# Altium project RS485_LoRa_Gateway.PrjPcb
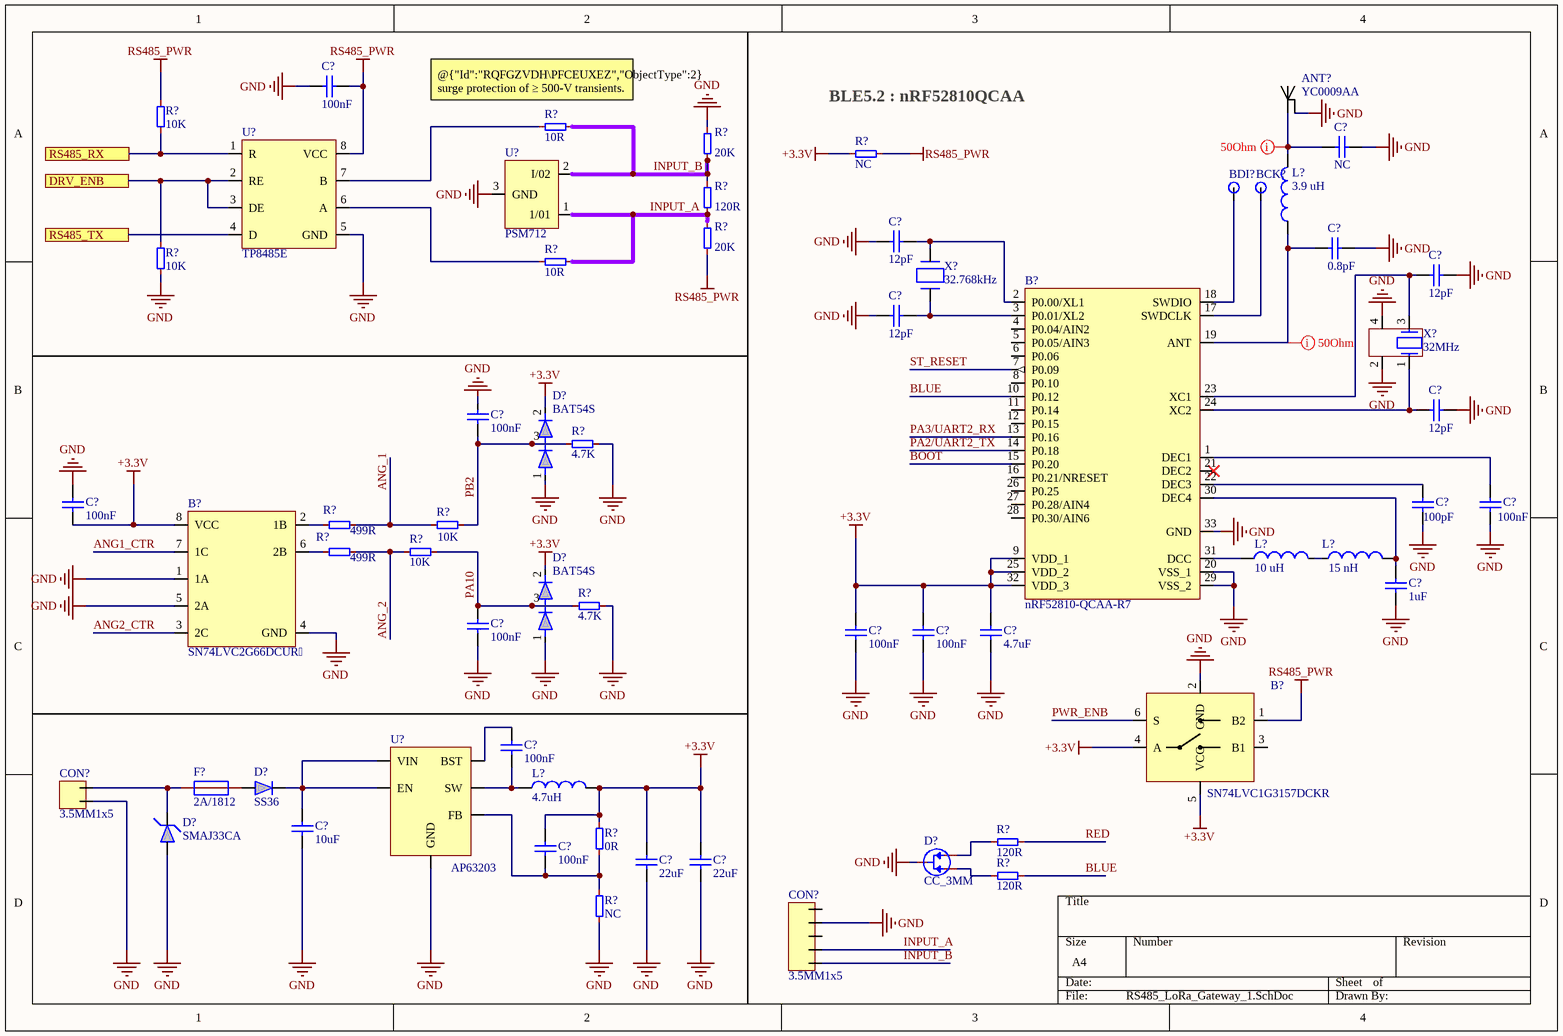
[diagram p0: RS485_LoRa_Gateway_1.SchDoc]
3 sheets, 117 parts. Net scope: flat (ports and power ports of the same name join across sheets).
Sheets:
  RS485_LoRa_Gateway_1.SchDoc
  RS485_LoRa_Gateway_2.SchDoc
  RS485_LoRa_Gateway_3.SchDoc

## Sheet RS485_LoRa_Gateway_1.SchDoc
size A4; SheetNumber: 1; SheetTotal: 3

### Parts
(Parts that share a designator on the sheet are numbered #1, #2 ... from top to bottom, then left to right.)
ANT?  YC0009AA  [YC009AA]
B?#1  nRF52810-QCAA-R7  [QFN50P500X500X95-33N]
B?#2  SN74LVC2G66DCUR  [SOP50P310X90-8N]
B?#3  SN74LVC1G3157DCKR  [SOT65P210X110-6N]
BCK?  -  [TH_Pad]  (value not drawn)  (net tie, no BOM)
BDI?  -  [TH_Pad]  (value not drawn)  (net tie, no BOM)
C?#1  100nF  [CAP0402]
C?#2  NC  [CAP0402]  (net tie, no BOM)
C?#3  12pF  [CAP0402]
C?#4  0.8pF  [CAP0402]
C?#5  12pF  [CAP0402]
C?#6  12pF  [CAP0402]
C?#7  100nF  [CAP0402]
C?#8  12pF  [CAP0402]
C?#9  100nF  [CAP0402]
C?#10  100pF  [CAP0402]
C?#11  100nF  [CAP0402]
C?#12  1uF  [CAP0603]
C?#13  100nF  [CAP0402]
C?#14  100nF  [CAP0402]
C?#15  100nF  [CAP0402]
C?#16  4.7uF  [CAP0603]
C?#17  100nF  [CAP0402]
C?#18  10uF  [CAP0805]
C?#19  100nF  [CAP0402]
C?#20  22uF  [CAP0805]
C?#21  22uF  [CAP0805]
CON?#1  3.5MM1x5  [SCREW TERMINAL BLOCK 3.5MM 2X1]
CON?#2  3.5MM1x5  [Terminal_Block_5-P3.5]
D?#1  BAT54S  [SOT23]
D?#2  BAT54S  [SOT23]
D?#3  SS36  [Diode SMD 214AC]
D?#4  SMAJ33CA  [Diode SMD 214AC]
D?#5  CC_3MM  [LED_BiColor_smd]
F?  2A/1812  [FUSC4632X85N]
L?#1  3.9 uH  [IND_0402]
L?#2  value 10 uH  [IND_0603]  (hidden comment: 10uH)
L?#3  value 15 nH  [IND_0402]  (hidden comment: 15nH)
L?#4  4.7uH  [IND_3x3x1.5MM]
R?#1  10K  [RESC0402]
R?#2  10R  [RESC0603]
R?#3  value 20K  [RESC0402]  (hidden comment: NC)
R?#4  NC  [RESC0402]
R?#5  value 120R  [RESC0402]  (hidden comment: NC)
R?#6  value 20K  [RESC0402]  (hidden comment: NC)
R?#7  10K  [RESC0402]
R?#8  10R  [RESC0603]
R?#9  4.7K  [RESC0402]
R?#10  499R  [RESC0805]
R?#11  10K  [RESC0402]
R?#12  499R  [RESC0805]
R?#13  10K  [RESC0402]
R?#14  4.7K  [RESC0402]
R?#15  0R  [RESC0402]
R?#16  120R  [RESC0402]
R?#17  120R  [RESC0402]
R?#18  NC  [RESC0402]
U?#1  TP8485E  [SOIC8]
U?#2  PSM712  [SOT23]
U?#3  AP63203  [SOT23-6]
X?#1  value 32.768kHz  [OSC_3215]  (hidden comment: VALUE)
X?#2  value 32MHz  [OSC_2016]  (hidden comment: OSC_2016)

### Ports
DRV_ENB, RS485_RX (see RS485_LoRa_Gateway_2[1B]), RS485_TX (see RS485_LoRa_Gateway_2[1B])

### Nets
+3.3V: B?#1.9(VDD_1) B?#1.25(VDD_2) B?#1.32(VDD_3) B?#2.8(VCC) B?#3.4(A) B?#3.5(VCC) C?#9.2 C?#14.2 C?#15.2 C?#16.2 C?#19.2 C?#20.2 C?#21.2 D?#1.2 D?#2.2 L?#4.2 R?#4.2 R?#15.1
GND: ANT?.2 B?#1.20(VSS_1) B?#1.29(VSS_2) B?#1.33(GND) B?#2.1(1A) B?#2.4(GND) B?#2.5(2A) B?#3.2(GND) C?#1.1 C?#2.1 C?#3.1 C?#4.1 C?#5.1 C?#6.1 C?#7.2 C?#8.1 C?#9.1 C?#10.2 C?#11.2 C?#12.1 C?#13.1 C?#14.1 C?#15.1 C?#16.1 C?#18.1 C?#20.1 C?#21.1 CON?#1.1 CON?#2.4 D?#1.1 D?#2.1 D?#4.2(A) D?#5.2(C) R?#3.2 R?#7.1 R?#9.1 R?#14.1 R?#18.2 U?#1.5(GND) U?#2.3(GND) U?#3.4(GND) X?#2.2 X?#2.4
RS485_PWR: B?#3.1(B2) C?#1.2 R?#1.2 R?#4.1 R?#6.1 U?#1.8(VCC)
ANG1_CTR: B?#2.7(1C)
ANG2_CTR: B?#2.3(2C)
ANG_1: R?#10.2 R?#11.2
ANG_2: R?#12.2 R?#13.2
BLUE: B?#1.10(P0.12) R?#17.1
BOOT: B?#1.15(P0.20)
INPUT_A: CON?#2.2 R?#5.1 R?#6.2 R?#8.2 U?#2.1(1/01)
INPUT_B: CON?#2.1 R?#2.2 R?#3.1 R?#5.2 U?#2.2(I/02)
PA2/UART2_TX: B?#1.14(P0.18)
PA3/UART2_RX: B?#1.13(P0.16)
PA10: C?#13.2 D?#2.3 R?#13.1 R?#14.2
PB2: C?#7.1 D?#1.3 R?#9.2 R?#11.1
PWR_ENB: B?#3.6(S)
RED: R?#16.1
ST_RESET: B?#1.7(P0.09)
NetANT?_1: ANT?.1 C?#2.2 L?#1.2
NetB?#1_1: B?#1.1(DEC1) C?#11.1
NetB?#1_2: B?#1.2(P0.00/XL1) C?#3.2 X?#1.2(X2)
NetB?#1_3: B?#1.3(P0.01/XL2) C?#6.2 X?#1.1(X1)
NetB?#1_17: B?#1.17(SWDCLK) BCK?.1
NetB?#1_18: B?#1.18(SWDIO) BDI?.1
NetB?#1_19: B?#1.19(ANT) C?#4.2 L?#1.1
NetB?#1_22: B?#1.22(DEC3) C?#10.1
NetB?#1_23: B?#1.23(XC1) C?#5.2 X?#2.3
NetB?#1_24: B?#1.24(XC2) C?#8.2 X?#2.1
NetB?#1_30: B?#1.30(DEC4) C?#12.2 L?#3.2
NetB?#1_31: B?#1.31(DCC) L?#2.1
NetB?#2_2: B?#2.2(1B) R?#10.1
NetB?#2_6: B?#2.6(2B) R?#12.1
NetC?#17_1: C?#17.1 L?#4.1 U?#3.5(SW)
NetC?#17_2: C?#17.2 U?#3.6(BST)
NetC?#18_2: C?#18.2 D?#3.1(K) U?#3.2(EN) U?#3.3(VIN)
NetC?#19_1: C?#19.1 R?#15.2 R?#18.1 U?#3.1(FB)
NetCON?#1_2: CON?#1.2 D?#4.1(K) F?.1
NetD?#3_2: D?#3.2(A) F?.2
NetD?#5_1: D?#5.1(A) R?#16.2
NetD?#5_3: D?#5.3(A) R?#17.2
NetL?#2_2: L?#2.2 L?#3.1
NetR?#1_1: R?#1.1 U?#1.1(R) ; port RS485_RX
NetR?#2_1: R?#2.1 U?#1.7(B)
NetR?#7_2: R?#7.2 U?#1.2(RE) U?#1.3(DE) ; port DRV_ENB
NetR?#8_1: R?#8.1 U?#1.6(A)
NetU?#1_4: U?#1.4(D) ; port RS485_TX

Not connected (* = marked no-connect by the designer): B?#1 4(P0.04/AIN2) 5(P0.05/AIN3) 6(P0.06) 8(P0.10) 11(P0.14) 12(P0.15) 16(P0.21/NRESET) 21(DEC2)* 26(P0.25) 27(P0.28/AIN4) 28(P0.30/AIN6); B?#3 3(B1); CON?#2 3 5

### Layout directives
net class 50Ohm; rule Width Constraint [Pref Width = 0.254mm    Min Width = 0.254mm    Max Width = 0.254mm]: NetANT?_1, NetB?#1_19

### Notes on the sheet
- (near R?#2) @{"Id":"RQFGZVDH\PFCEUXEZ","ObjectType":2}  surge protection of ≥ 500-V transients.
- (near R?#4) BLE5.2 : nRF52810QCAA

### Library data of the parts
ANT? = YC0009AA: Antennas Embedded, 2400-2500 MHz, Wi-Fi (Bluetooth), Ceramic, -, -, SMD, 3.2 YCA009AA; Manufacturer: Quectel; Manufacturer_Part_Number: YC0009AA
B?#1 = nRF52810-QCAA-R7: NORDIC SEMICONDUCTOR - NRF52810-QCAA-R7 - RF Transceiver, 2.36GHz to 2.5GHz, FSK, 2Mbps, 4dBm out, -89dBm in, 1.7V to 3.6V, QFN-32; Manufacturer: Nordic Semiconductor; Manufacturer_Part_Number: nRF52810-QCAA-R7
B?#2 = SN74LVC2G66DCUR: 2-Channel, 1:1 Analog Switch with Low On-State Resistance; Manufacturer: Texas Instruments; Manufacturer_Part_Number: SN74LVC2G66DCUR
B?#3 = SN74LVC1G: SN74LVC1G3157DCKR, Analogue Switch Single SPDT, 3, 5V, 6-Pin, SC-70; Manufacturer: Texas Instruments; Geometry.Height: 1.1mm; Manufacturer_Part_Number: SN74LVC1G3157DCKR; Arrow Part Number: SN74LVC1G3157DCKR; Arrow Price/Stock: https://www.arrow.com/en/products/sn74lvc1g3157dckr/texas-instruments?region=nac; Datasheet Link: http://www.ti.com/lit/ds/symlink/sn74lvc1g3157.pdf
BCK? BDI? = TH_PAD: Through Hole pad 1mm 0.5mm Hole
C?#1 C?#7 C?#9 C?#11 C?#13-C?#15 C?#17 C?#19 = Capa_0402: Ceramic Capacitor C0G, NP0 0402 100nF 35V; Manufacturer_Part_Number: GRM155R61A104KA01J; Manufacturer: MURATA
C?#2 = Capa_0402
C?#3 C?#5 C?#6 C?#8 = Capa_0402: Multilayer Ceramic Capacitors MLCC - SMD/SMT 50 V 12 pF C0G 0402 5%; Manufacturer_Part_Number: CC0402JRNPO9BN120; Manufacturer: YAGEO
C?#4 = Capa_0402: Ceramic Capacitor C0G, NP0 0402 0.8pF 50V; Manufacturer_Part_Number: CC0402BRNPO9BNR80; Manufacturer: YAGEO
C?#10 = Capa_0402: Ceramic Capacitor C0G, NP0 0402 100nF 50V; Manufacturer_Part_Number: GRM1555C1H101FA01D; Manufacturer: MURATA
C?#12 = Capa_0603: MLCC - SMD/SMT 1 uF 16 VDC 10% 0603 X5R; Manufacturer_Part_Number: GRM188R61C105MA12D; Manufacturer: MURATA
C?#16 = Capa_0603: MLCC - SMD/SMT 4.7 uF 16 VDC 10% 0603 X5R; Manufacturer_Part_Number: CL10A475KQ8NNNC; Manufacturer: Samsung Electro-Mechanics
C?#18 = Capa_0805: MLCC - SMD/SMT 10 uF 50VDC 10% 0805 X6S; Manufacturer_Part_Number: CC0805KKX5R9BB106; Manufacturer: YAGEO
C?#20 = Capa_0805: MLCC - SMD/SMT 22uF 10VDC 20% 0805 X6S; Manufacturer_Part_Number: CC0805KKX7R6BB226; Manufacturer: YAGEO
C?#21 = Capa_0805: MLCC - SMD/SMT 22uF 10VDC 20% 0805 X6S; Manufacturer_Part_Number: CC0805KKX7R6BB226; Manufacturer: MURATA
CON?#1 = Screw Terminal Block 2x1 3.5mm: 3.5mm 1*2 Screw Terminal Block; Manufacturer: XINYA; Package: 1x2x3.5; Manufacturer_Part_Number: *; Supplier: ROBU; Price: *
CON?#2 = Screw Terminal Block 5x1 3.5mm: 3.5mm 1*5 Screw Terminal Block
D?#1 D?#2 = BAT54SWT1G: BAT54S Schottky Diodes & Rectifiers SS SHKY DIO 30V TR; Manufacturer_Part_Number: Nexperia; Manufacturer: BAT54S,235
D?#3 = DIODE: SS36-Slkor-60V 750mV@3A 3A SMA(DO-214AC) Schottky Diodes ROHS\; Manufacturer: Slkor; Manufacturer_Part_Number: SS36; Supplier: Robu; Price: *; Package: DO-214AC
D?#4 = DIODE-ESD: SMAJ36A - 36V 400W ESD Suppressor TVS Diodes 2Pin SMA DO-214AC; Manufacturer: JD; Manufacturer_Part_Number: SMAJ33CA; Supplier: Eveleta; Package: DO-214AC; Price: *
D?#5 = LED_CC: LED Common cathod
F? = Fuse: Resettable Fuse - PTC 24V 01.5A 1812 - SMD1812B150TF/24; Manufacturer: Yageo; Manufacturer_Part_Number: SMD1812B150TF/24; Package: SMD1812; Supplier: *
L?#1 = Inductor: 3.9 nH High frequency chip inductor ±5%  0402; Manufacturer_Part_Number: LQG15HS3N9B02D; Manufacturer: Murata
L?#2 = MCD-01330: 10uH Chip inductor, IDC,min = 50 mA, ±20% 0603; Manufacturer_Part_Number: MLZ1608E100MT; Manufacturer: TDK
L?#3 = MCD-01330: 15 nH High frequency chip inductor ±10% 0402; Manufacturer_Part_Number: LQG15HN15NJ02D; Manufacturer: Murata
L?#4 = INDUCTOR: 1.09A 4.7uH ±3% 163mΩ 3015 Inductors; Manufacturer_Part_Number: SWPA3015S4R7MT; Manufacturer: SUNLORD; Package: 3015; Supplier: Evelta; Price: 6.9
R?#1 R?#7 = RES_0402: Thick Film Resistors - SMD 1/16watt 10Kohms 0402 1% Commercial Use; Manufacturer_Part_Number: CRCW040210K0FKEDC; Manufacturer: Vishay; Parameter 1: *
R?#2 R?#8 = RES_0603: Thick Film Resistors - SMD 1/10Watt 10ohms 1% Commercial Use; Manufacturer_Part_Number: CRCW060310R0FKEBC; Manufacturer: Vishay; Parameter 1: *
R?#3 R?#5 R?#6 = RES_0402: Resistor SMD 0402; Manufacturer_Part_Number: *; Manufacturer: *
R?#4 = RES_0402: Thick Film Resistors - SMD 1/16watt 0R 1% 0402 Commercial Use; Manufacturer_Part_Number: RC0402FR-070RL; Manufacturer: YAGEO; Parameter 1: *
R?#9 R?#14 = RES_0402: Thin Film Resistors - SMD 4.7Kohms 0.1% 0402 25ppm; Manufacturer_Part_Number: RT0402BRD074K7L; Manufacturer: YAGEO; Parameter 1: *
R?#10 R?#12 = RES_0805: Thin Film Resistors - SMD 499ohms 0.1% 25ppm; Manufacturer_Part_Number: TNPW0805499RBEEA; Manufacturer: Vishay; Parameter 1: *
R?#11 R?#13 R?#18 = RES_0402: Thick Film Resistors - SMD 1/16watt 10Kohms 0.1% 0402 Commercial Use; Manufacturer_Part_Number: MCS04020D1002BE000; Manufacturer: Vishay; Parameter 1: *
R?#15 = RES_0402: Thick Film Resistors - SMD 1/16watt 0R 1% 0402 Commercial Use; Manufacturer_Part_Number: RC0402FR-070RL; Manufacturer: Vishay; Parameter 1: *
R?#16 = RES_0402: Thin Film Resistors - SMD 120Kohms 1% 0402 25ppm; Manufacturer_Part_Number: RT0402FRE07120RL; Manufacturer: YAGEO; Parameter 1: *
R?#17 = RES_0402: Thin Film Resistors - SMD 120Rs 1% 0402 25ppm; Manufacturer_Part_Number: RT0402FRE07120RL; Manufacturer: YAGEO; Parameter 1: *
U?#1 = TP8485E: TP8485E RS485 Tranreciver 3V-5.5V SOIC8; Manufacturer: 3PEAK; Manufacturer_Part_Number: TP8485
U?#2 = PSM712: Asymmerical TVS Diode for Extended Common-Mode RS-485; Manufacturer_Part_Number: SM712H-TP-B002; Manufacturer: Micro Commercial Components (MCC)
U?#3 = AP63205: AP63205 - Switching Voltage Regulators 5V OUT DCDC 3.8V-32V Conv HV Buck TSOT26 T&R 3K; Manufacturer_Part_Number: AP63203QWU-7; Manufacturer: Diodes Incorporated; Price: *
X?#1 = OSC_2012: Crystal Osc 2012; Manufacturer_Part_Number: ECS-.327-12.5-34B-TR; Manufacturer: ECS
X?#2 = OSC_2016: Crystal Osc 2016 32MHz; Manufacturer_Part_Number: XRCGB32M000F2P01R0; Manufacturer: Murata

## Sheet RS485_LoRa_Gateway_2.SchDoc
size A4; SheetNumber: 2; SheetTotal: 3
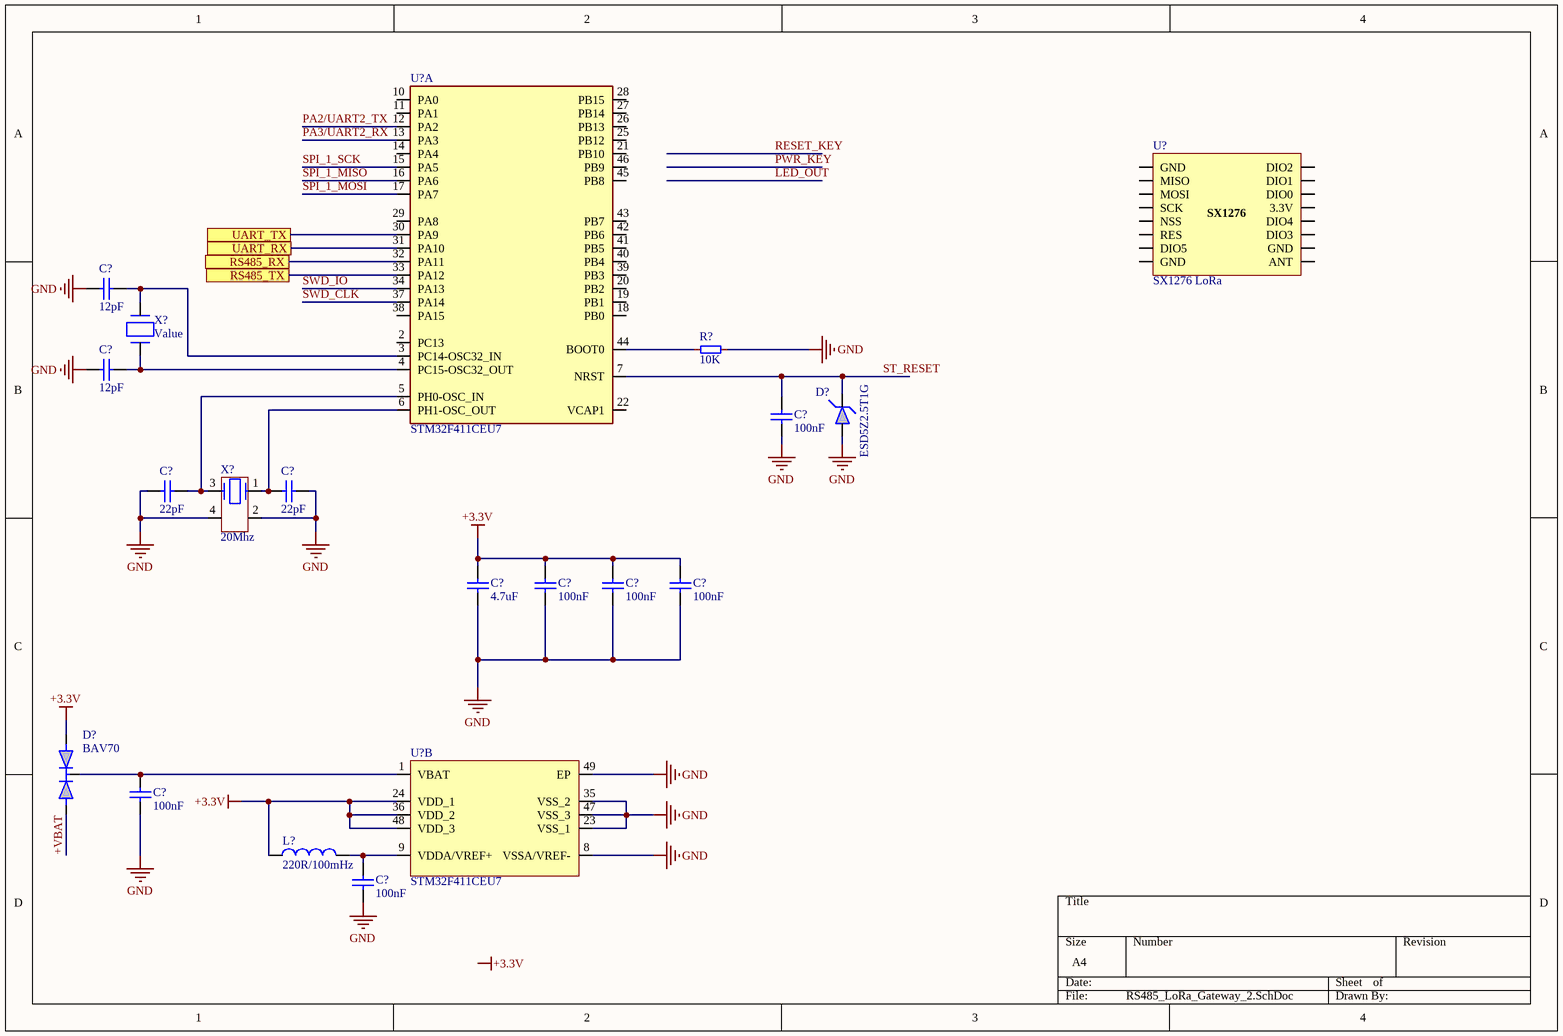
[diagram p1: RS485_LoRa_Gateway_2.SchDoc]

### Parts
(Parts that share a designator on the sheet are numbered #1, #2 ... from top to bottom, then left to right.)
C?#22  12pF  [CAP0402]
C?#23  12pF  [CAP0402]
C?#24  100nF  [CAP0402]
C?#25  22pF  [CAP0402]
C?#26  22pF  [CAP0402]
C?#27  4.7uF  [CAP0603]
C?#28  100nF  [CAP0402]
C?#29  100nF  [CAP0402]
C?#30  100nF  [CAP0402]
C?#31  100nF  [CAP0402]
C?#32  100nF  [CAP0402]
D?#6  ESD5Z2.5T1G  [SOD523]
D?#7  BAV70  [SOT23-3]
L?#5  220R/100mHz  [IND_0603]
R?#19  10K  [RESC0402]
U?#4  STM32F411CEU7  [QFN48]  (part A of 2)
U?#5  SX1276 LoRa  [RFM95]
U?#6  STM32F411CEU7  [QFN48]  (part B of 2)
X?#3  32.768kHz  [OSC_3215]  (value not drawn)
X?#4  20Mhz  [OSC_3225]

### Ports
RS485_RX (see RS485_LoRa_Gateway_1[1A]), RS485_TX (see RS485_LoRa_Gateway_1[1A]), UART_RX (see RS485_LoRa_Gateway_3[5C]), UART_TX (see RS485_LoRa_Gateway_3[6C])

### Nets
+3.3V: C?#27.2 C?#28.2 C?#29.2 C?#30.2 D?#7.1 L?#5.1 U?#6.24(VDD_1) U?#6.36(VDD_2) U?#6.48(VDD_3)
GND: C?#22.2 C?#23.2 C?#24.1 C?#25.2 C?#26.1 C?#27.1 C?#28.1 C?#29.1 C?#30.1 C?#31.1 C?#32.1 D?#6.2(A) R?#19.1 U?#6.8(VSSA/VREF-) U?#6.23(VSS_1) U?#6.35(VSS_2) U?#6.47(VSS_3) U?#6.49(EP) X?#4.2 X?#4.4
+VBAT: D?#7.2
PA2/UART2_TX: U?#4.12(PA2)
PA3/UART2_RX: U?#4.13(PA3)
SPI_1_MISO: U?#4.16(PA6)
SPI_1_MOSI: U?#4.17(PA7)
SPI_1_SCK: U?#4.15(PA5)
ST_RESET: C?#24.2 D?#6.1(K) U?#4.7(NRST)
SWD_CLK: U?#4.37(PA14)
SWD_IO: U?#4.34(PA13)
NetB4_1: U?#4.31(PA10) ; port UART_RX
NetB4_8: U?#4.30(PA9) ; port UART_TX
NetC?#22_1: C?#22.1 U?#4.3(PC14-OSC32_IN) X?#3.2(X2)
NetC?#23_1: C?#23.1 U?#4.4(PC15-OSC32_OUT) X?#3.1(X1)
NetC?#25_1: C?#25.1 U?#4.5(PH0-OSC_IN) X?#4.3
NetC?#26_2: C?#26.2 U?#4.6(PH1-OSC_OUT) X?#4.1
NetC?#31_2: C?#31.2 D?#7.3 U?#6.1(VBAT)
NetC?#32_2: C?#32.2 L?#5.2 U?#6.9(VDDA/VREF+)
NetR?#1_1: U?#4.32(PA11) ; port RS485_RX
NetR?#19_2: R?#19.2 U?#4.44(BOOT0)
NetU?#1_4: U?#4.33(PA12) ; port RS485_TX

Not connected (* = marked no-connect by the designer): U?#4 2(PC13) 10(PA0) 11(PA1) 14(PA4) 18(PB0) 19(PB1) 20(PB2) 21(PB10) 22(VCAP1) 25(PB12) 26(PB13) 27(PB14) 28(PB15) 29(PA8) 38(PA15) 39(PB3) 40(PB4) 41(PB5) 42(PB6) 43(PB7) 45(PB8) 46(PB9); U?#5 1(GND) 2(MISO) 3(MOSI) 4(SCK) 5(NSS) 6(RES) 7(DIO5) 8(GND) 9(ANT) 10(GND) 11(DIO3) 12(DIO4) 13(3.3V) 14(DIO0) 15(DIO1) 16(DIO2)

### Notes on the sheet
- Labels drawn without touching a wire or pin: +3.3V
- (in symbol SX1276 LoRa) SX1276

### Library data of the parts
C?#22 C?#23 = CAP_0402: Ceramic Capacitor NP0 0402 12pF 50V; Manufacturer_Part_Number: GRM1555C1H120GA01D; Manufacturer: MURATA; Supplier: *; Package: 0402; Price: *
C?#24 C?#28-C?#32 = Capa_0402: as C?#1 on sheet RS485_LoRa_Gateway_1
C?#25 C?#26 = CAP_0402: Ceramic Capacitor NP0 0402 22pF 50V; Manufacturer_Part_Number: GRM1555C1H220GA01D; Manufacturer: MURATA; Supplier: *; Package: 0402; Price: *
C?#27 = Capa_0603: as C?#16 on sheet RS485_LoRa_Gateway_1
D?#6 = DIODE-ESD: ESD Protection Diodes / TVS Diodes 2.5V ESD Protection Unidirectional; Manufacturer: onsemi; Manufacturer_Part_Number: ESD5Z2.5T1G
D?#7 = BAV70: BAV70 Dual Small Signal Switching Diode; Manufacturer: Generic; Manufacturer_Part_Number: BAV70; Package: SOT-23; Supplier: Mouser
L?#5 = IND_0603: 700mA 220R 100mHz Feride bead 0603; Manufacturer: MURATA; Manufacturer_Part_Number: BLM18AG221SN1D; Value: *; Package: 0603; Price: *; Supplier: MOUSER/ROBU
R?#19 = RES_0402: as R?#1 on sheet RS485_LoRa_Gateway_1; Parameter 1: *
U?#4 U?#6 = STM32F411CEU7: ARM Microcontrollers - MCU High-performance access line, Arm Cortex-M4 core DSP & FPU, 512 Kbytes of Flash; Manufacturer: STMicroelectronics; Manufacturer_Part_Number: STM32F411CEU7; Package: UFQFPN-48
U?#5 = SX1276 LoRa: SX1276 LoRa SMD
X?#3 = OSC_3215: Crystal Osc 3215 2Pin 32.768kHz 2Pin 9pF; Manufacturer_Part_Number: *; Manufacturer: *; Package: 3215; Value: Value
X?#4 = OSC_3225: Crystal Osc 3225 4 Pin 20Mhz 20pF; Manufacturer_Part_Number: X322520MSB4SI; Manufacturer: YXC; Package: 3225; Price: *; Value: 20Mhz

## Sheet RS485_LoRa_Gateway_3.SchDoc
size A3; SheetNumber: 3; SheetTotal: 3
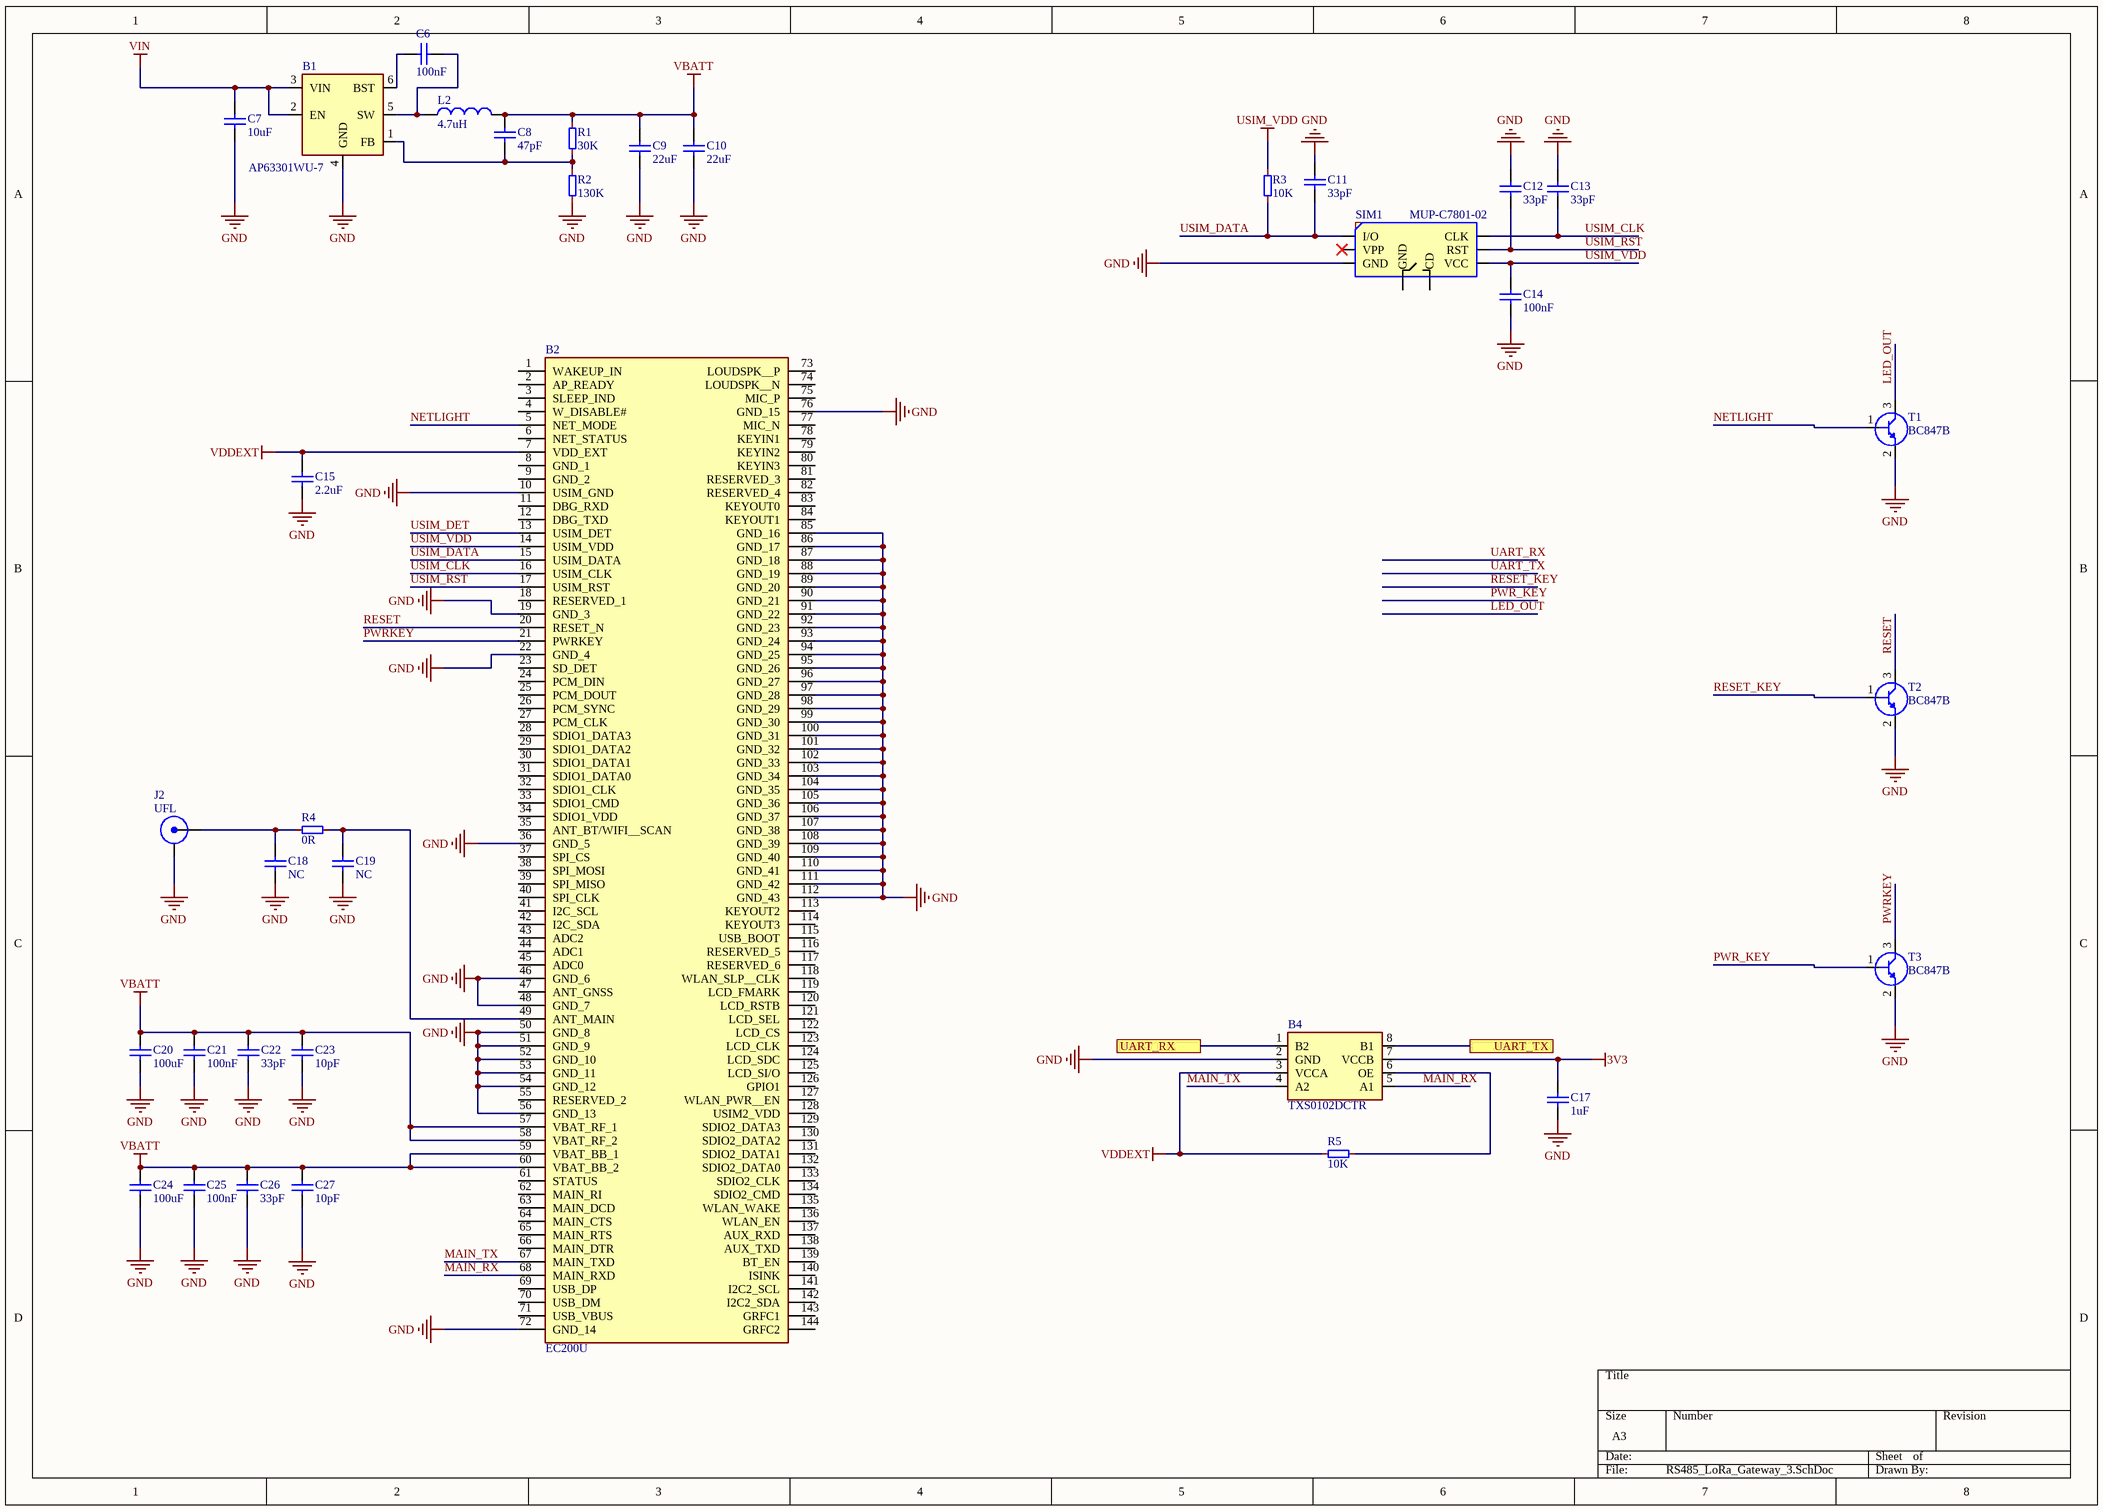
[diagram p2: RS485_LoRa_Gateway_3.SchDoc]

### Parts
B1  AP63301WU-7  [SOT95P280X100-6N]
B2  EC200U  [EC200U]
B4  TXS0102DCTR  [SOP65P400X130-8N]
C6  100nF  [CAP0402]
C7  10uF  [CAP0805]
C8  47pF  [CAP0402]
C9  22uF  [CAP0805]
C10  22uF  [CAP0805]
C11  33pF  [CAP0402]
C12  33pF  [CAP0402]
C13  33pF  [CAP0402]
C14  100nF  [CAP0402]
C15  2.2uF  [CAP0402]
C17  1uF  [CAP0402]
C18  NC  [CAP0402]  (net tie, no BOM)
C19  NC  [CAP0402]  (net tie, no BOM)
C20  100uF  [CAP1206]
C21  100nF  [CAP0402]
C22  33pF  [CAP0402]
C23  10pF  [CAP0402]
C24  100uF  [CAP1206]
C25  100nF  [CAP0402]
C26  33pF  [CAP0402]
C27  10pF  [CAP0402]
J2  UFL  [UFL]
L2  4.7uH  [IND_5.0x5.0x4.0]
R1  30K  [RESC0402]
R2  130K  [RESC0402]
R3  10K  [RESC0402]
R4  0R  [RESC0402]
R5  10K  [RESC0402]
SIM1  MUP-C7801-02  [MUP-C7801-2]
T1  BC847B  [SOT23]
T2  BC847B  [SOT23]
T3  BC847B  [SOT23]

### Ports
UART_RX (see RS485_LoRa_Gateway_2[1A]), UART_TX (see RS485_LoRa_Gateway_2[1A])

### Nets
3V3: B4.7(VCCB) C17.2
GND: B1.4(GND) B2.10(USIM_GND) B2.19(GND_3) B2.22(GND_4) B2.36(GND_5) B2.46(GND_6) B2.48(GND_7) B2.50(GND_8) B2.51(GND_9) B2.52(GND_10) B2.53(GND_11) B2.54(GND_12) B2.56(GND_13) B2.72(GND_14) B2.76(GND_15) B2.85(GND_16) B2.86(GND_17) B2.87(GND_18) B2.88(GND_19) B2.89(GND_20) B2.90(GND_21) B2.91(GND_22) B2.92(GND_23) B2.93(GND_24) B2.94(GND_25) B2.95(GND_26) B2.96(GND_27) B2.97(GND_28) B2.98(GND_29) B2.99(GND_30) B2.100(GND_31) B2.101(GND_32) B2.102(GND_33) B2.103(GND_34) B2.104(GND_35) B2.105(GND_36) B2.106(GND_37) B2.107(GND_38) B2.108(GND_39) B2.109(GND_40) B2.110(GND_41) B2.111(GND_42) B2.112(GND_43) B4.2(GND) C7.1 C9.1 C10.1 C11.1 C12.1 C13.1 C14.2 C15.1 C17.1 C18.1 C19.1 C20.1 C21.2 C22.2 C23.2 C24.1 C25.2 C26.2 C27.2 J2.2(Y) R2.1 SIM1.GND T1.2(E) T2.2(E) T3.2(E)
USIM_VDD: B2.14(USIM_VDD) C14.1 R3.1 SIM1.VCC
VBATT: B2.57(VBAT_RF_1) B2.58(VBAT_RF_2) B2.59(VBAT_BB_1) B2.60(VBAT_BB_2) C8.1 C9.2 C10.2 C20.2 C21.1 C22.1 C23.1 C24.2 C25.1 C26.1 C27.1 L2.2 R1.2
VDDEXT: B2.7(VDD_EXT) B4.3(VCCA) C15.2 R5.1
VIN: B1.2(EN) B1.3(VIN) C7.2
LED_OUT: T1.3(C)
MAIN_RX: B2.68(MAIN_RXD) B4.5(A1)
MAIN_TX: B2.67(MAIN_TXD) B4.4(A2)
NETLIGHT: B2.5(NET_MODE) T1.1(B)
PWR_KEY: T3.1(B)
PWRKEY: B2.21(PWRKEY) T3.3(C)
RESET: B2.20(RESET_N) T2.3(C)
RESET_KEY: T2.1(B)
USIM_CLK: B2.16(USIM_CLK) C13.2 SIM1.CLK
USIM_DATA: B2.15(USIM_DATA) C11.2 R3.2 SIM1.I/O
USIM_DET: B2.13(USIM_DET)
USIM_RST: B2.17(USIM_RST) C12.2 SIM1.RST
NetB1_1: B1.1(FB) C8.2 R1.1 R2.2
NetB1_5: B1.5(SW) C6.2 L2.1
NetB1_6: B1.6(BST) C6.1
NetB2_49: B2.49(ANT_MAIN) C19.2 R4.2
NetB4_1: B4.1(B2) ; port UART_RX
NetB4_6: B4.6(OE) R5.2
NetB4_8: B4.8(B1) ; port UART_TX
NetC18_2: C18.2 J2.1(X) R4.1

Not connected (* = marked no-connect by the designer): B2 1(WAKEUP_IN) 2(AP_READY) 3(SLEEP_IND) 4(W_DISABLE#) 6(NET_STATUS) 8(GND_1) 9(GND_2) 11(DBG_RXD) 12(DBG_TXD) 18(RESERVED_1) 23(SD_DET) 24(PCM_DIN) 25(PCM_DOUT) 26(PCM_SYNC) 27(PCM_CLK) 28(SDIO1_DATA3) 29(SDIO1_DATA2) 30(SDIO1_DATA1) 31(SDIO1_DATA0) 32(SDIO1_CLK) 33(SDIO1_CMD) 34(SDIO1_VDD) 35(ANT_BT/WIFI__SCAN) 37(SPI_CS) 38(SPI_MOSI) 39(SPI_MISO) 40(SPI_CLK) 41(I2C_SCL) 42(I2C_SDA) 43(ADC2) 44(ADC1) 45(ADC0) 47(ANT_GNSS) 55(RESERVED_2) 61(STATUS) 62(MAIN_RI) 63(MAIN_DCD) 64(MAIN_CTS) 65(MAIN_RTS) 66(MAIN_DTR) 69(USB_DP) 70(USB_DM) 71(USB_VBUS) 73(LOUDSPK__P) 74(LOUDSPK__N) 75(MIC_P) 77(MIC_N) 78(KEYIN1) 79(KEYIN2) 80(KEYIN3) 81(RESERVED_3) 82(RESERVED_4) 83(KEYOUT0) 84(KEYOUT1) 113(KEYOUT2) 114(KEYOUT3) 115(USB_BOOT) 116(RESERVED_5) 117(RESERVED_6) 118(WLAN_SLP__CLK) 119(LCD_FMARK) 120(LCD_RSTB) 121(LCD_SEL) 122(LCD_CS) 123(LCD_CLK) 124(LCD_SDC) 125(LCD_SI/O) 126(GPIO1) 127(WLAN_PWR__EN) 128(USIM2_VDD) 129(SDIO2_DATA3) 130(SDIO2_DATA2) 131(SDIO2_DATA1) 132(SDIO2_DATA0) 133(SDIO2_CLK) 134(SDIO2_CMD) 135(WLAN_WAKE) 136(WLAN_EN) 137(AUX_RXD) 138(AUX_TXD) 139(BT_EN) 140(ISINK) 141(I2C2_SCL) 142(I2C2_SDA) 143(GRFC1) 144(GRFC2); SIM1 CD VPP*

### Library data of the parts
B1 = AP63301WU-7: 3.8V TO 32V INPUT, 3A LOW IQ SYNCHRONOUS BUCK WITH ENHANCED EMI REDUCTION.; Manufacturer: Diodes Incorporated; Geometry.Height: 1mm; Mouser Part Number: 621-AP63301WU-7; Mouser Price/Stock: https://www.mouser.co.uk/ProductDetail/Diodes-Incorporated/AP63301WU-7?qs=bZr6mbWTK5mxozg17S0lNg%3D%3D; Manufacturer_Part_Number: AP63301WU-7; Datasheet Link: https://www.diodes.com//assets/Datasheets/AP63300-AP63301.pdf
B2 = EC200U: LTE standard module Bluetooth wireless communication 4G cat1 module all-network; Manufacturer_Name: Quectel; Geometry.Height: 2.6mm; Manufacturer_Part_Number: EC200U; Mouser Part Number: *; Mouser Price/Stock: *; Arrow Part Number: *; Arrow Price/Stock: *; Datasheet Link: https://drive.google.com/file/d/1eptLu98ynaKmYC8Qn_q-jmLHFTbR9duW/view?usp=sharing
B4 = TXS0102DCTR: Translation - Voltage Levels 2B Bidir Vltg-Level Translator; Manufacturer: Texas Instruments; Geometry.Height: 1.3mm; Mouser Part Number: TXS0102DCTR; Mouser Price/Stock: https://www.mouser.co.uk/ProductDetail/Texas-Instruments/TXS0102DCTTE4?qs=IUbkBnfnSQLBbpjVS5PRXQ%3D%3D; Manufacturer_Part_Number: TXS0102DCTR; Datasheet Link: https://www.ti.com/lit/ds/symlink/txs0102.pdf?ts=1619522054575&ref_url=https%253A%252F%252Fwww.ti.com%252Fstore%252Fti%252Fen%252Fp%252Fproduct%252F%253Fp%253DTXS0102DCTT
C6 C14 C21 C25 = Capa_0402: as C?#1 on sheet RS485_LoRa_Gateway_1
C7 = Capa_0805: Ceramic Capacitor C0G, NP0 0805 10uF 50V; Manufacturer_Part_Number: CC0805KKX5R9BB106; Manufacturer: YAGEO
C8 = Capa_0402: Ceramic Capacitor C0G, NP0 0402 47pF 35V; Manufacturer_Part_Number: CC0402JRNPO9BN470; Manufacturer: YAGEO
C9 C10 = Capa_0805: Ceramic Capacitor C0G, NP0 0805 22uF 0805 20%; Manufacturer_Part_Number: 0805B226K500CT; Manufacturer: Walsin
C11-C13 C22 C26 = Capa_0402: 33pF 50V Capacitor 5% Tolerance CC0402JRNPO9BN330- 0402 Package; Manufacturer: YAGEO; Manufacturer_Part_Number: CC0402JRNPO9BN330
C15 = Capa_0402: Ceramic Capacitor C0G, 2.2uF NP0 0402; Manufacturer_Part_Number: CC1206ZKY5V9BB225; Manufacturer: YAGEO
C17 = Capa_0402: Ceramic Capacitor C0G, 1uF NP0 0402; Manufacturer_Part_Number: CC0402KRX7R9BB105; Manufacturer: YAGEO
C18 C19 = Capa_0402: Ceramic Capacitor C0G, NC NP0 0402; Manufacturer_Part_Number: CC0402KRX7R9BB105; Manufacturer: YAGEO
C20 C24 = Capa_1206: MLCC - SMD/SMT 100uF 10 VDC 20% 1206 X6S; Manufacturer_Part_Number: GRM31CR61A107MEA8K; Manufacturer: MURATA
C23 C27 = Capa_0402: Ceramic Capacitor C0G, NP0 0402 10pF 35V; Manufacturer_Part_Number: CC0402JRNPO9BN100; Manufacturer: YAGEO
J2 = SMA_T_9.52_NF: SMA Jack, UFL Edge Mount, 50 Ohms; Manufacturer: SAMTEC; Manufacturer_Part_Number: SMA-J-P-H-ST-EM1
L2 = Inductor: 4.7uH 3A 20% 39mOhm Shielded Wirewound Power Inductor SMD; Manufacturer_Part_Number: SWPA5040S4R7MT; Manufacturer: Shenzhen Sunlord
R1 = Resister: 30K 1% 0402 SMD Thick-Film Chip Resistor - Royal Ohm; Manufacturer_Part_Number: 0402WGF3002TCE; Package: 0402; Manufacturer: Royal Ohm
R2 = Resister: 130K 1% 0402 SMD Thick-Film Chip Resistor - Royal Ohm; Manufacturer_Part_Number: 0402WGF1303TCE; Package: 0402; Manufacturer: Royal Ohm
R3 R5 = Resister: 10K 1% 0402 SMD Thick-Film Chip Resistor - WALSIN; Manufacturer_Part_Number: WR04X1002FTL; Package: 0402; Manufacturer: WALSIN
R4 = Resister: 0R 1% 0402 SMD Thick-Film Chip Resistor - Yageo; Manufacturer_Part_Number: RC0402FR-070RL; Package: 0402; Manufacturer: YAGEO
SIM1 = MUP-C7801-02: MUP-C7801-02 – Push-Push Nano Sim Card Connector Without Post Normally Closed – 7Pin SMD Package; Manufacturer: MUP Industrial; Manufacturer_Part_Number: MUP-C7801-02
T1-T3 = BC847: BC847B – NPN General Purpose Transistor – SOT-23 Package; Manufacturer: Nexperia; Package: SOT23; Manufacturer_Part_Number: BC847B; Supplier-2: *

## Nets that join several sheets
+3.3V: RS485_LoRa_Gateway_1 (18 pins), RS485_LoRa_Gateway_2 (9 pins)
GND: RS485_LoRa_Gateway_1 (43 pins), RS485_LoRa_Gateway_2 (20 pins), RS485_LoRa_Gateway_3 (69 pins)
NetB4_1: RS485_LoRa_Gateway_2 (U?#4.31), RS485_LoRa_Gateway_3 (B4.1)
NetB4_8: RS485_LoRa_Gateway_2 (U?#4.30), RS485_LoRa_Gateway_3 (B4.8)
NetR?#1_1: RS485_LoRa_Gateway_1 (R?#1.1 U?#1.1), RS485_LoRa_Gateway_2 (U?#4.32)
NetU?#1_4: RS485_LoRa_Gateway_1 (U?#1.4), RS485_LoRa_Gateway_2 (U?#4.33)